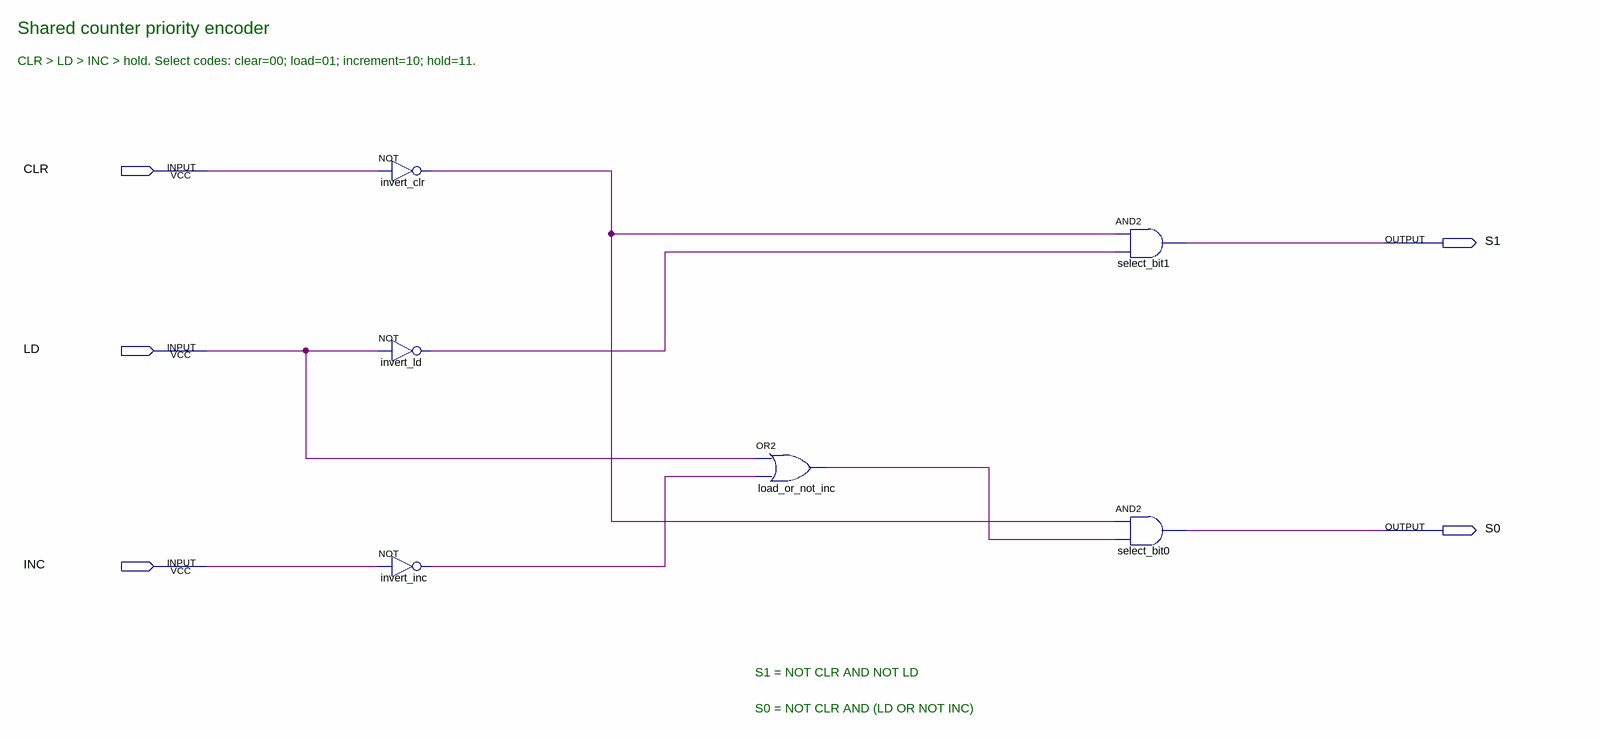
[diagram p0: schematic sheet]
// Quartus schematic priority_control.bdf as structural Verilog: 6 symbols, 5 pins
module priority_control (
  input  CLR,
  input  LD,
  input  INC,
  output S1,
  output S0
);

  wire LOAD_OR_NINC, NCLR, NINC, NLD;

  not invert_clr (NCLR, CLR);
  not invert_ld (NLD, LD);
  not invert_inc (NINC, INC);
  or load_or_not_inc (LOAD_OR_NINC, LD, NINC);
  and select_bit1 (S1, NCLR, NLD);
  and select_bit0 (S0, NCLR, LOAD_OR_NINC);

  // Notes on the sheet:
  //   Shared counter priority encoder
  //   CLR > LD > INC > hold. Select codes: clear=00; load=01; increment=10; hold=11.
  //   S1 = NOT CLR AND NOT LD
  //   S0 = NOT CLR AND (LD OR NOT INC)
endmodule
